# Altium schematic sheet Connector_Sheet.SchDoc
size A4; SheetNumber: 1; SheetTotal: 1
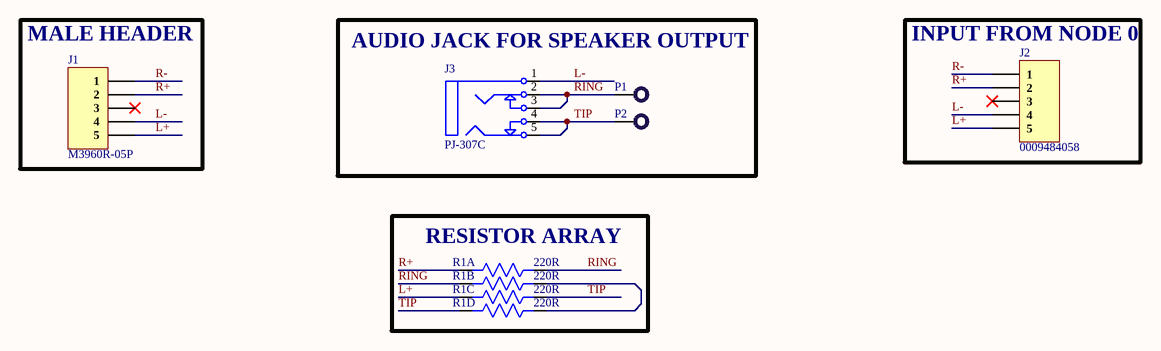
[diagram p0: Connector_Sheet.SchDoc]

## Parts
J1  M3960R-05P  [M3960R-05P]
J2  0009484058  [0009484058]
J3  PJ-307C  [PJ-307C]
P1  Test Point  [TEST POINT]  (value not drawn)
P2  Test Point  [TEST POINT]  (value not drawn)
R1  220R  [4608X-102-221LF]  (parts A,B,C,D of 4)

## Blocks framed on the sheet
MALE HEADER: J1
AUDIO JACK FOR SPEAKER OUTPUT: J3 P1 P2
INPUT FROM NODE 0: J2
RESISTOR ARRAY: R1

## Nets
L+: J1.5 J2.5 R1.5
L-: J1.4 J2.4 J3.1
R+: J1.2 J2.2 R1.1
R-: J1.1 J2.1
RING: J3.2 J3.3 P1.1 R1.2 R1.3
TIP: J3.4 J3.5 P2.1 R1.6 R1.7
NetR1_4: R1.4 R1.8

Not connected (* = marked no-connect by the designer): J1 3*; J2 3*

## Notes on the sheet
- 1
- Huzaifa Ali

## Library data of the parts
J1 = M3960R-05P: 1x5P 1 3.96mm Male pin 5 Shrouded Plugin,P=3.96mm Wire To Board / Wire To Wire Connector ROHS; Manufacturer: XFCN; Manufacturer Part No: M3960R-05P; ComponentLink1Description: LCSC; ComponentLink1URL: https://www.lcsc.com/product-detail/Wire-To-Board-Wire-To-Wire-Connector_XFCN-M3960R-05P_C492523.html
J2 = 0009484058: CONN RCPT 5POS 0.156 TIN PCB; Manufacturer: Molex; Supplier 1: Newark; Manufacturer Part Number: 09-48-4058; RoHS: Yes; Category: Headers and Wire Housings; Stock 1: 536; Pricing 1: 1=1.40000, 10=1.14000, 25=1.08000, 50=1.02000, 100=0.95900, 250=0.91000 (USD); ComponentLink1URL: https://datasheet.ciiva.com/5152/0009484058-pcb-receptacles-156345-5152334.pdf?src-supplier=Mouser; ComponentLink1Description: https://datasheet.ciiva.com/5152/0009484058-pcb-receptacles-156345-5152334.pdf?src-supplier=Mouser; ComponentLink2URL: https://datasheet.ciiva.com/30162/135130009484058-pcb-receptacles-30162639.pdf?src-supplier=Onlinecomponents.com; ComponentLink2Description: https://datasheet.ciiva.com/30162/135130009484058-pcb-receptacles-30162639.pdf?src-supplier=Onlinecomponents.com; ComponentLink3URL: https://datasheet.ciiva.com/3935/54480009484058-pcb-receptacles-3935610.pdf?src-supplier=Arrow+Electronics; ComponentLink3Description: https://datasheet.ciiva.com/3935/54480009484058-pcb-receptacles-3935610.pdf?src-supplier=Arrow+Electronics; ComponentLink4URL: https://datasheet.ciiva.com/23692/ps-08-50-23692432.pdf?src-supplier=Newark; ComponentLink4Description: https://datasheet.ciiva.com/23692/ps-08-50-23692432.pdf?src-supplier=Newark; Supplier Part Number 1: 99AC9867
J3 = PJ-307C: 3.5mm headphone jack 30V 500mA Plugin Audio Connectors ROHS; Manufacturer: BOOMELE; Manufacturer Part No: PJ-307C; Package: Custom; ComponentLink1Description: LCSC; ComponentLink1URL: https://www.lcsc.com/product-detail/span-style-background-color-ff0-Audio-span-Connectors_BOOMELE-Boom-Precision-Elec-PJ-307C_C16684.html
P1 P2 = TEST POINT: Test Point ON
R1 = 4608X-102-221LF: RES ARRAY 4 RES 220 OHM 8SIP; Manufacturer: Bourns; Number of Terminals/Pins: 8; Power Rating: 1W; Number of Resistors: 4; Temperature Coefficient: 100ppm/°C; Tolerance: 2%; Voltage Rating: 100V; Circuit Type: Isolated; Power Per Element: 300mW; Insulation Resistance: 10GR; Lead Length: 3.43mm; Supplier 1: RSComponents; Manufacturer Part Number: 4608X-102-221LF; RoHS: Yes; Category: Resistor Arrays; Stock 1: 1; Pricing 1: 25=0.31900, 625=0.15300, 1250=0.13900, 2500=0.13200 (USD); Mount: Through Hole; Case/Package: SIP; Number of Pins: 8; Material: Resin,Epoxy; Min Operating Temperature: -55°C; Max Operating Temperature: 125°C; Resistance: 220R; Number of Elements: 4; Voltage Rating (DC): 100V; Packaging: Bulk; Package Quantity: 200; Termination: Pin; Number of Contacts: 8; Series: 4600X; Technology: THICK FILM; Resistance Tolerance: 2%; Length: 20.27mm; Width: 0.098inch; Height: 0.2inch; Terminal Pitch: 2.54mm; Depth: 2.49mm; Thickness: 0.096inch; Radiation Hardening: No; REACH SVHC: No SVHC; Military Standard: Not; Lead Free: Lead Free; RoHS Compliant: Yes; ComponentLink1URL: https://datasheet.ciiva.com/14179/ee4609x-14179600.pdf?src-supplier=Distrelec; ComponentLink1Description: https://datasheet.ciiva.com/14179/ee4609x-14179600.pdf?src-supplier=Distrelec; ComponentLink2URL: https://datasheet.ciiva.com/11807/0900766b8069ccfd-11807176.pdf?src-supplier=RSComponents; ComponentLink2Description: https://datasheet.ciiva.com/11807/0900766b8069ccfd-11807176.pdf?src-supplier=RSComponents; ComponentLink3URL: https://datasheet.ciiva.com/3263/4600x-3263657.pdf?src-supplier=Avnet; ComponentLink3Description: https://datasheet.ciiva.com/3263/4600x-3263657.pdf?src-supplier=Avnet; ComponentLink4URL: https://datasheet.ciiva.com/15158/getdatasheetpartid-201762-15158038.pdf?src-supplier=Verical; ComponentLink4Description: https://datasheet.ciiva.com/15158/getdatasheetpartid-201762-15158038.pdf?src-supplier=Verical; ComponentLink5URL: https://datasheet.ciiva.com/16827/4600x-16827721.pdf?src-supplier=Avnet+Europe; ComponentLink5Description: https://datasheet.ciiva.com/16827/4600x-16827721.pdf?src-supplier=Avnet+Europe; ComponentLink6URL: https://datasheet.ciiva.com/2690/4600x-2690298.pdf?src-supplier=Digi-Key; ComponentLink6Description: https://datasheet.ciiva.com/2690/4600x-2690298.pdf?src-supplier=Digi-Key; ComponentLink7URL: https://datasheet.ciiva.com/30208/4600x-30208038.pdf?src-supplier=Onlinecomponents.com; ComponentLink7Description: https://datasheet.ciiva.com/30208/4600x-30208038.pdf?src-supplier=Onlinecomponents.com; ComponentLink8URL: https://datasheet.ciiva.com/14583/70154307-14583677.pdf?src-supplier=Allied+Electronics; ComponentLink8Description: https://datasheet.ciiva.com/14583/70154307-14583677.pdf?src-supplier=Allied+Electronics; ComponentLink9URL: https://datasheet.ciiva.com/1133/682196-1133120.pdf?src-supplier=Element14; ComponentLink9Description: https://datasheet.ciiva.com/1133/682196-1133120.pdf?src-supplier=Element14; Supplier Part Number 1: 5223882